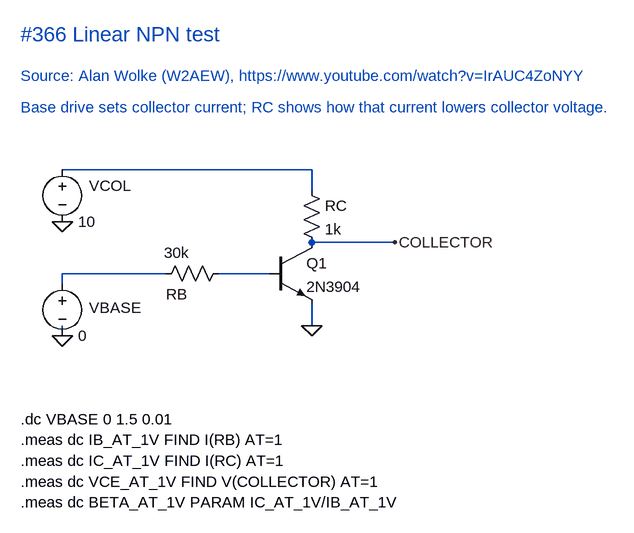
[diagram p0: schematic Linear NPN test.asc]
Linear NPN test.asc, the LTspice schematic file:
Version 4.1
SHEET 1 1120 800
WIRE 480 240 96 240
WIRE 480 272 480 240
WIRE 608 352 480 352
WIRE 256 400 96 400
WIRE 416 400 336 400
WIRE 96 416 96 400
WIRE 480 480 480 448
WIRE 96 496 96 480
FLAG 96 496 0
FLAG 480 480 0
FLAG 96 320 0
FLAG 608 352 COLLECTOR
SYMBOL voltage 96 400 R0
WINDOW 0 41 53 Left 2
SYMATTR InstName VBASE
SYMATTR Value 0
SYMBOL res 240 416 R270
WINDOW 0 0 32 VBottom 2
WINDOW 3 32 32 VTop 2
SYMATTR InstName RB
SYMATTR Value 30k
SYMBOL npn 416 352 R0
SYMATTR InstName Q1
SYMATTR Value 2N3904
SYMBOL res 464 256 R0
SYMATTR InstName RC
SYMATTR Value 1k
SYMBOL voltage 96 224 R0
WINDOW 0 41 41 Left 2
SYMATTR InstName VCOL
SYMATTR Value 10
TEXT 32 32 Left 3 ;#366 Linear NPN test
TEXT 32 96 Left 2 ;Source: Alan Wolke (W2AEW), https://www.youtube.com/watch?v=IrAUC4ZoNYY
TEXT 32 144 Left 2 ;Base drive sets collector current; RC shows how that current lowers collector voltage.
TEXT 32 624 Left 2 !.dc VBASE 0 1.5 0.01
TEXT 32 656 Left 2 !.meas dc IB_AT_1V FIND I(RB) AT=1
TEXT 32 688 Left 2 !.meas dc IC_AT_1V FIND I(RC) AT=1
TEXT 32 720 Left 2 !.meas dc VCE_AT_1V FIND V(COLLECTOR) AT=1
TEXT 32 752 Left 2 !.meas dc BETA_AT_1V PARAM IC_AT_1V/IB_AT_1V

The netlist it stands for:
* Linear NPN test.asc
VBASE N002 0 0
RB N002 N003 30k
Q1 COLLECTOR N003 0 0 2N3904
RC N001 COLLECTOR 1k
VCOL N001 0 10
.model NPN NPN
.model PNP PNP
.lib standard.bjt
* #366 Linear NPN test
* Source: Alan Wolke (W2AEW), https://www.youtube.com/watch?v=IrAUC4ZoNYY
* Base drive sets collector current; RC shows how that current lowers collector voltage.
.dc VBASE 0 1.5 0.01
.meas dc IB_AT_1V FIND I(RB) AT=1
.meas dc IC_AT_1V FIND I(RC) AT=1
.meas dc VCE_AT_1V FIND V(COLLECTOR) AT=1
.meas dc BETA_AT_1V PARAM IC_AT_1V/IB_AT_1V
.backanno
.end